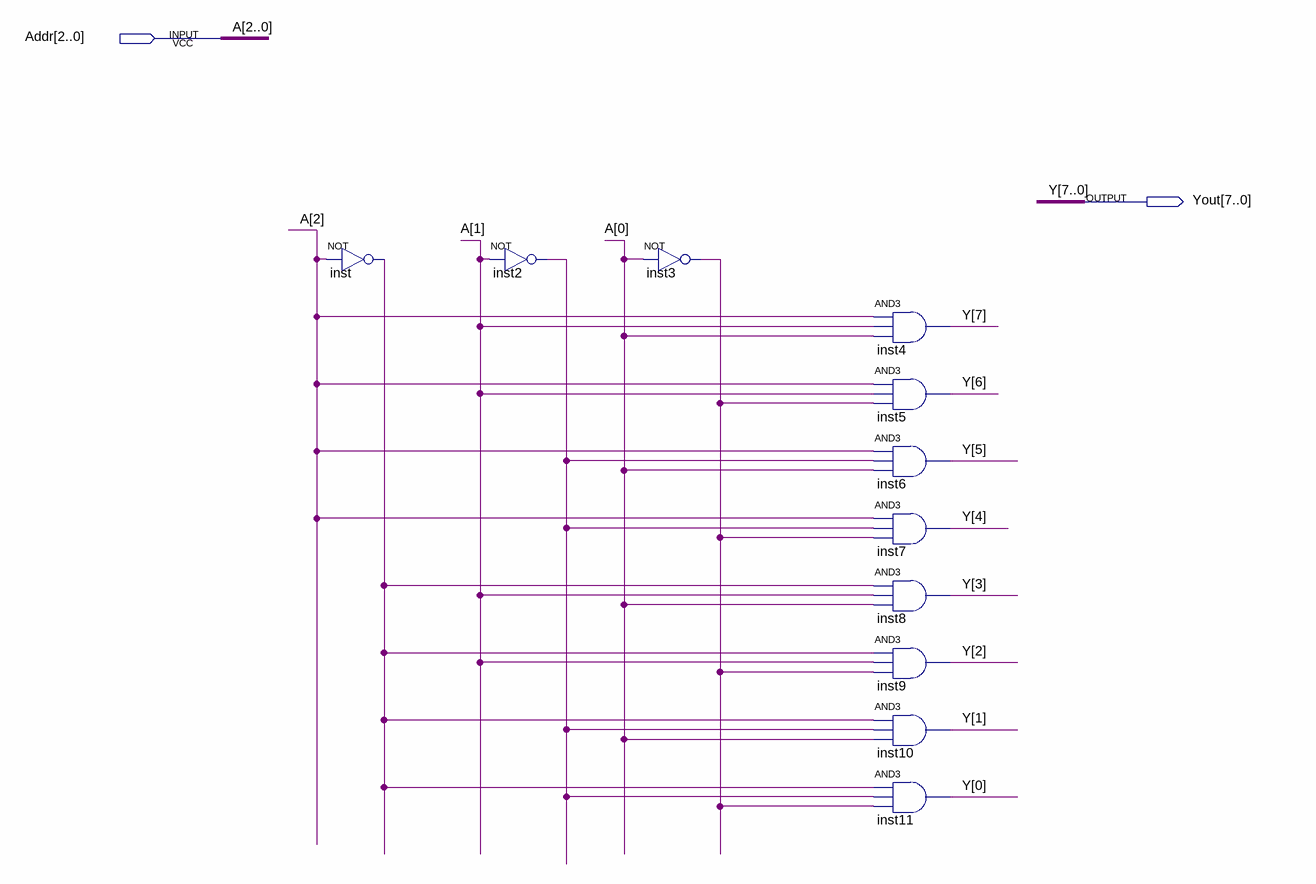
[diagram p0: schematic sheet]
// Quartus schematic DEC38.bdf as structural Verilog: 11 symbols, 2 pins
module DEC38 (
  input  [2:0] Addr,
  output [7:0] Yout
);

  wire inst2_out, inst3_out, inst_out;

  not inst (inst_out, Addr[2]);
  not inst2 (inst2_out, Addr[1]);
  not inst3 (inst3_out, Addr[0]);
  and inst4 (Yout[7], Addr[2], Addr[1], Addr[0]);
  and inst5 (Yout[6], Addr[2], Addr[1], inst3_out);
  and inst6 (Yout[5], Addr[2], inst2_out, Addr[0]);
  and inst7 (Yout[4], Addr[2], inst2_out, inst3_out);
  and inst8 (Yout[3], inst_out, Addr[1], Addr[0]);
  and inst9 (Yout[2], inst_out, Addr[1], inst3_out);
  and inst10 (Yout[1], inst_out, inst2_out, Addr[0]);
  and inst11 (Yout[0], inst_out, inst2_out, inst3_out);

  // Other names for the same wires on the sheet: A[2:0] = Addr; Y[7:0] = Yout
endmodule
